# EasyEDA Pro project ProPrj_核心板—舵机连接部分_2025-04-28.epro

# Schematic Schematic1
Board Name: Board1; Create Date: 2025-04-08; Page Name: P1; Project Name: 省赛1终版; Schematic Name: Schematic1; Update Date: 2025-04-08; Company: 嘉立创EDA; Page Size: A4; Version: V1.0
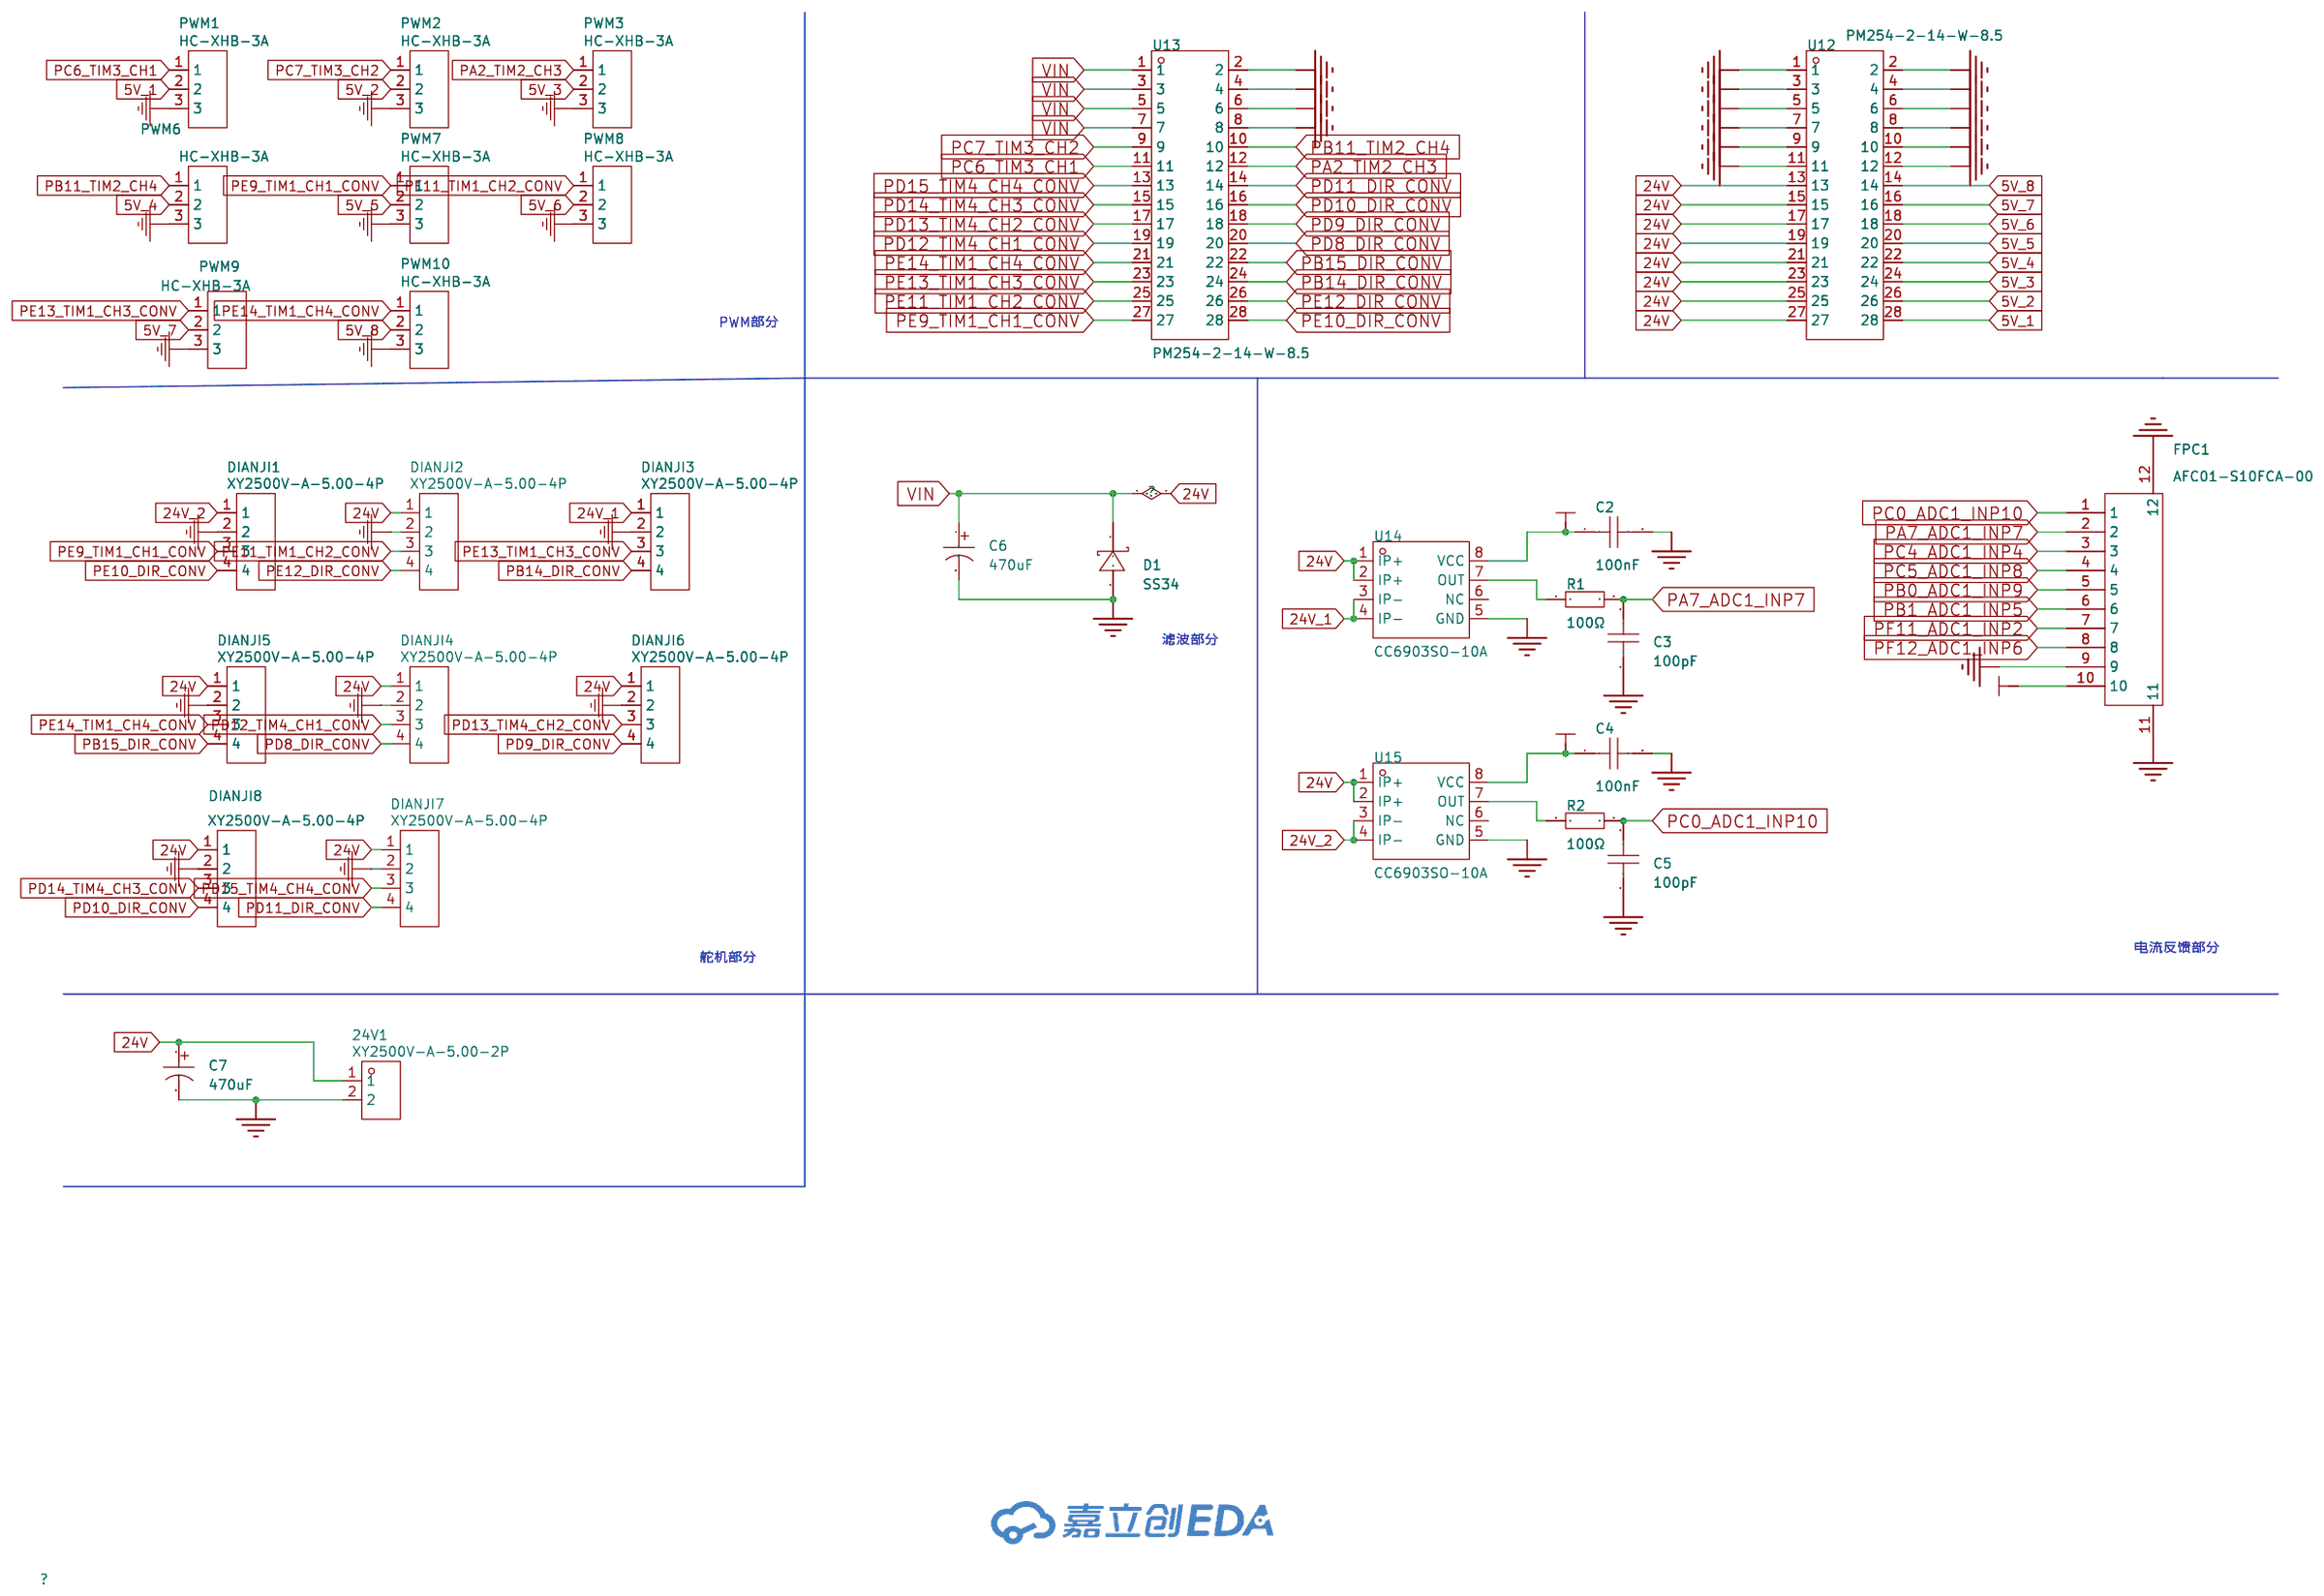
[diagram p0: schematic sheet]

## Parts
24V1  XY2500V-A-5.00-2P  [CONN-TH_XY2500V-A-5.00-2P]
C2  100nF  [C0603]
C3  100pF  [C0603]
C4  100nF  [C0603]
C5  100pF  [C0603]
C6  470uF  [CAP-TH_BD10.0-P5.00-D1.0-FD]
C7  470uF  [CAP-TH_BD10.0-P5.00-D1.0-FD]
D1  SS34  [SMA_L4.3-W2.6-LS5.2-RD]
DIANJI1  XY2500V-A-5.00-4P  [CONN-TH_XY2500V-A-5.00-4P]
DIANJI2  XY2500V-A-5.00-4P  [CONN-TH_XY2500V-A-5.00-4P]
DIANJI3  XY2500V-A-5.00-4P  [CONN-TH_XY2500V-A-5.00-4P]
DIANJI4  XY2500V-A-5.00-4P  [CONN-TH_XY2500V-A-5.00-4P]
DIANJI5  XY2500V-A-5.00-4P  [CONN-TH_XY2500V-A-5.00-4P]
DIANJI6  XY2500V-A-5.00-4P  [CONN-TH_XY2500V-A-5.00-4P]
DIANJI7  XY2500V-A-5.00-4P  [CONN-TH_XY2500V-A-5.00-4P]
DIANJI8  XY2500V-A-5.00-4P  [CONN-TH_XY2500V-A-5.00-4P]
FPC1  AFC01-S10FCA-00  [FPC-SMD_P0.5-10P_FGS-XJ-H2.0]
PWM1  HC-XHB-3A  [CONN-TH_3P-P2.50_HC-XHB-3A]
PWM2  HC-XHB-3A  [CONN-TH_3P-P2.50_HC-XHB-3A]
PWM3  HC-XHB-3A  [CONN-TH_3P-P2.50_HC-XHB-3A]
PWM6  HC-XHB-3A  [CONN-TH_3P-P2.50_HC-XHB-3A]
PWM7  HC-XHB-3A  [CONN-TH_3P-P2.50_HC-XHB-3A]
PWM8  HC-XHB-3A  [CONN-TH_3P-P2.50_HC-XHB-3A]
PWM9  HC-XHB-3A  [CONN-TH_3P-P2.50_HC-XHB-3A]
PWM10  HC-XHB-3A  [CONN-TH_3P-P2.50_HC-XHB-3A]
R1  100Ω  [R0805]
R2  100Ω  [R0805]
U12  PM254-2-14-W-8.5  [HDR-TH_28P-P2.54-H-F-R2-C14-W8.5]
U13  PM254-2-14-W-8.5  [HDR-TH_28P-P2.54-H-F-R2-C14-W8.5]
U14  CC6903SO-10A  [SOP-8_L4.9-W3.9-P1.27-LS6.0-BL]
U15  CC6903SO-10A  [SOP-8_L4.9-W3.9-P1.27-LS6.0-BL]

## Library data of the parts
24V1 = XY2500V-A-5.00-2P: 连接器类型:板端/插座-开口;结构:1x2P;间距:5mm;颜色:绿色;安装方式:直针;排数:1;每排PIN数:2;额定电流:15A;额定电压:300V;触头材质:黄铜;触头镀层:锡;工作温度范围:-;; LCSC Part Name: 1x2P 5mm 排数:1 每排P数:2; Supplier Part: C505761; Manufacturer: XINLAIYA(新莱亚); Supplier Footprint: 插件,P=5mm; JLCPCB Part Class: Extended Part; Datasheet: https://atta.szlcsc.com/upload/public/pdf/source/20200331/C505762_203BBA30CC567BF272D649DCBBD7E810.pdf; Supplier: LCSC; Connector Type: 板端/插座-开口; Structure: 1x2P; Pitch: 5mm; Color: 绿色; Mounting Style: 直针; Number of Pins: 2P; Number of Rows: 1; Number of PINs Per Row: 2; Current Rating (Max): 15A; Voltage Rating (Max): 300V; Contact Material: 黄铜; Contact Plating: 锡
C2 C4 = CGA0603X7R104K500JT: 容值:100nF;精度:±10%;额定电压:50V;温度系数:X7R;; LCSC Part Name: 100nF ±10% 50V; Supplier Part: C6119867; Manufacturer: HRE(芯声); Supplier Footprint: 0603; JLCPCB Part Class: 扩展库; Datasheet: https://atta.szlcsc.com/upload/public/pdf/source/20250103/C44077DA9E7B3EFAE02F22B6D3D1CBC9.pdf; Supplier: LCSC; Tolerance: ±10%; Voltage Rating: 50V; Temperature Coefficient: X7R
C3 C5 = CC0603JRNPO9BN101: 容值:100pF;精度:±5%;额定电压:50V;材质(温度系数):NP0;; LCSC Part Name: 100pF ±5% 50V; Supplier Part: C14665; Manufacturer: YAGEO(国巨); Supplier Footprint: 0603; JLCPCB Part Class: Extended Part; Datasheet: https://atta.szlcsc.com/upload/public/pdf/source/20181008/C309499_21CC21451B82C39E3D92150FD6B30293.pdf; Supplier: LCSC; Tolerance: ±5%; Voltage Rated: 50V; Temperature Coefficient: NP0
C6 C7 = ERS1HM471G20OT: 容值:470uF;精度:±20%;额定电压:50V;; LCSC Part Name: 470uF ±20% 50V; Supplier Part: C106666; Manufacturer: AISHI(艾华集团); Supplier Footprint: 插件,D10xL20mm; JLCPCB Part Class: 扩展库; Datasheet: https://atta.szlcsc.com/upload/public/pdf/source/20191015/C438940_4B8E60A742BB0AE40DDEF87A5C89089D.pdf; Supplier: LCSC; Tolerance: ±20%; Rated Voltage: 50V; Lead Spacing: 5mm; φD: 10mm; L: 20mm; Lifetime @ Temp: 7000hrs@105℃
D1 = SS34_C8678: 二极管配置:独立式;正向压降(Vf):550mV@3A;直流反向耐压(Vr):40V;整流电流:3A;; LCSC Part Name: 电压:40V 电流:3A; Supplier Part: C8678; Manufacturer: MDD(辰达半导体); Supplier Footprint: SMA(DO-214AC); JLCPCB Part Class: 基础库; Datasheet: https://atta.szlcsc.com/upload/public/pdf/source/20240710/2118BB86FDDB2E0B294389AC1F3F65C8.pdf; Supplier: LCSC; Diode Configuration: 独立式; Forward Voltage (Vf@If): 550mV@3A; Reverse Voltage (Vr): 40V; Rectified Current: 3A; Reverse Leakage Current (Ir): 500uA@40V
DIANJI1-DIANJI8 = XY2500V-A-5.00-4P: 连接器类型:板端/插座-开口;结构:1x4P;间距:5mm;颜色:绿色;安装方式:直针;排数:1;每排PIN数:4;额定电流:15A;额定电压:300V;触头材质:黄铜;触头镀层:锡;工作温度范围:-;; LCSC Part Name: 1x4P 5mm 排数:1 每排P数:4; Supplier Part: C505763; Manufacturer: XINLAIYA(新莱亚); Supplier Footprint: 插件,P=5mm; JLCPCB Part Class: Extended Part; Datasheet: https://atta.szlcsc.com/upload/public/pdf/source/20200331/C505762_203BBA30CC567BF272D649DCBBD7E810.pdf; Supplier: LCSC; Connector Type: 板端/插座-开口; Structure: 1x4P; Pitch: 5mm; Color: 绿色; Mounting Style: 直针; Number of Pins: 4P; Number of Rows: 1; Number of PINs Per Row: 4; Current Rating (Max): 15A; Voltage Rating (Max): 300V; Contact Material: 黄铜; Contact Plating: 锡
FPC1 = AFC01-S10FCA-00: 锁定特性:翻盖式;触点类型:下接;触点数量:10P;间距:0.5mm;安装类型:卧贴;; LCSC Part Name: 间距:0.5mm P数:10P 翻盖式 下接; Supplier Part: C262659; Manufacturer: JS(钜硕电子); Supplier Footprint: SMD,P=0.5mm,卧贴; JLCPCB Part Class: 扩展库; Datasheet: https://atta.szlcsc.com/upload/public/pdf/source/20190816/C413942_2A72D1AC756EAE17EEDF756A339D4500.pdf; Supplier: LCSC; Locking Feature: 翻盖式; Contact Type: 下接; Number of Contacts: 10P; Pitch: 0.5mm; Mounting Type: 卧贴; FFC, FCB Thickness: 0.3mm; Height Above Board: 2mm
PWM1-PWM3 PWM6-PWM10 = HC-XHB-3A: Supplier: LCSC; Supplier Part: C2845491; Manufacturer: HCTL(华灿天禄); JLCPCB Part Class: Extended Part
R1 R2 = 0805W8F1000T5E: 电阻类型:厚膜电阻;阻值:100Ω;精度:±1%;功率:125mW;最大工作电压:150V;温度系数:±100ppm/℃;; LCSC Part Name: 100Ω ±1% 125mW 厚膜电阻; Supplier Part: C17408; Manufacturer: UNI-ROYAL(厚声); Supplier Footprint: 0805; JLCPCB Part Class: Basic Part; Datasheet: https://atta.szlcsc.com/upload/public/pdf/source/20200306/C422600_1E6D84923E4A46A82E41ADD87F860B5C.pdf; Supplier: LCSC; Type: 厚膜电阻; Tolerance: ±1%; Power(Watts): 125mW; Overload Voltage (Max): 150V; Temperature Coefficient: ±100ppm/℃; Operating Temperature Range: -55℃~+155℃
U12 U13 = PM254-2-14-W-8.5: 插孔结构:2x14P;间距:2.54mm;行距:2.54mm;圆孔/方孔:方孔;安装类型:弯插;排数:双排;总孔位数:28P;额定电流:3A;额定电压:-;插孔方向:侧面;塑高:8.5mm;触头材质:铜合金;工作温度范围:-40℃~+105℃;焊接温度(最大值):260℃@5S;; LCSC Part Name: 2x14P 间距:2.54mm 弯插; Supplier Part: C2897434; Manufacturer: HCTL(华灿天禄); Supplier Footprint: 弯插,P=2.54mm; JLCPCB Part Class: Extended Part; Datasheet: https://atta.szlcsc.com/upload/public/pdf/source/20230609/283C0D22EF4E6FFE03D5A855876981ED.pdf; Supplier: LCSC; Holes Structure: 2x14P; Pitch: 2.54mm; Row Spacing: 2.54mm; Circular Hole / Square Hole: 方孔; Mounting Type: 弯插; Number of Rows: 双排; Number of Holes: 28P; Current Rating (Max): 3A; Holes Direction: 侧面; Insulation Height: 8.5mm; Contact Material: 铜合金; Operating Temperature Range: -40℃~+105℃; Soldering Temperature(Max): 260℃@5S
U14 U15 = CC6903SO-10A: 电流测量范围:-10A~10A;隔离耐压:100Vrms;灵敏度:132mV/A;; Supplier Part: C469386; Manufacturer: CrossChip(成都芯进); Supplier Footprint: SOP-8; JLCPCB Part Class: 扩展库; Datasheet: https://atta.szlcsc.com/upload/public/pdf/source/20210401/C469386_736CACCB33E89B0F82D9E8414A64AB06.pdf; Supplier: LCSC; Current Range: -10A~10A; Supply Voltage: 3.3V; Isolated Voltage Withstand: 100Vrms; Sensitivity: 132mV/A; Standby Current: 5mA; Operating Temperature: -40℃~+125℃

## Nets
3V32: C2.1 C4.1 FPC1.10 U14.8(VCC) U15.8(VCC)
5V_1: PWM1.2 U12.28
5V_2: PWM2.2 U12.26
5V_3: PWM3.2 U12.24
5V_4: PWM6.2 U12.22
5V_5: PWM7.2 U12.20
5V_6: PWM8.2 U12.18
5V_7: PWM9.2 U12.16
5V_8: PWM10.2 U12.14
24V: 24V1.1 C6.1 C7.1 D1.1(K) DIANJI2.1 DIANJI4.1 DIANJI5.1 DIANJI6.1 DIANJI7.1 DIANJI8.1 U12.13 U12.15 U12.17 U12.19 U12.21 U12.23 U12.25 U12.27 U13.1 U13.3 U13.5 U13.7 U14.1(IP+) U14.2(IP+) U15.1(IP+) U15.2(IP+)
24V_1: DIANJI3.1 U14.3(IP-) U14.4(IP-)
24V_2: DIANJI1.1 U15.3(IP-) U15.4(IP-)
GND: 24V1.2 C2.2 C3.1 C4.2 C5.1 C6.2 C7.2 D1.2(A) DIANJI1.2 DIANJI2.2 DIANJI3.2 DIANJI4.2 DIANJI5.2 DIANJI6.2 DIANJI7.2 DIANJI8.2 FPC1.9 FPC1.11 FPC1.12 PWM1.3 PWM2.3 PWM3.3 PWM6.3 PWM7.3 PWM8.3 PWM9.3 PWM10.3 U12.1 U12.2 U12.3 U12.4 U12.5 U12.6 U12.7 U12.8 U12.9 U12.10 U12.11 U12.12 U13.2 U13.4 U13.6 U13.8 U14.5(GND) U15.5(GND)
PA2_TIM2_CH3: PWM3.1 U13.12
PA7_ADC1_INP7: C3.2 FPC1.2 R1.2
PB0_ADC1_INP9: FPC1.5
PB1_ADC1_INP5: FPC1.6
PB11_TIM2_CH4: PWM6.1 U13.10
PB14_DIR_CONV: DIANJI3.4 U13.24
PB15_DIR_CONV: DIANJI5.4 U13.22
PC0_ADC1_INP10: C5.2 FPC1.1 R2.2
PC4_ADC1_INP4: FPC1.3
PC5_ADC1_INP8: FPC1.4
PC6_TIM3_CH1: PWM1.1 U13.11
PC7_TIM3_CH2: PWM2.1 U13.9
PD8_DIR_CONV: DIANJI4.4 U13.20
PD9_DIR_CONV: DIANJI6.4 U13.18
PD10_DIR_CONV: DIANJI8.4 U13.16
PD11_DIR_CONV: DIANJI7.4 U13.14
PD12_TIM4_CH1_CONV: DIANJI4.3 U13.19
PD13_TIM4_CH2_CONV: DIANJI6.3 U13.17
PD14_TIM4_CH3_CONV: DIANJI8.3 U13.15
PD15_TIM4_CH4_CONV: DIANJI7.3 U13.13
PE9_TIM1_CH1_CONV: DIANJI1.3 PWM7.1 U13.27
PE10_DIR_CONV: DIANJI1.4 U13.28
PE11_TIM1_CH2_CONV: DIANJI2.3 PWM8.1 U13.25
PE12_DIR_CONV: DIANJI2.4 U13.26
PE13_TIM1_CH3_CONV: DIANJI3.3 PWM9.1 U13.23
PE14_TIM1_CH4_CONV: DIANJI5.3 PWM10.1 U13.21
PF11_ADC1_INP2: FPC1.7
PF12_ADC1_INP6: FPC1.8
$1N7510: R1.1 U14.7(OUT)
$1N7913: R2.1 U15.7(OUT)

Not connected (* = marked no-connect by the designer): U14 6(NC); U15 6(NC)

## Notes on the sheet
- PWM部分
- 滤波部分
- 电流反馈部分
- 舵机部分

# Board PCB1
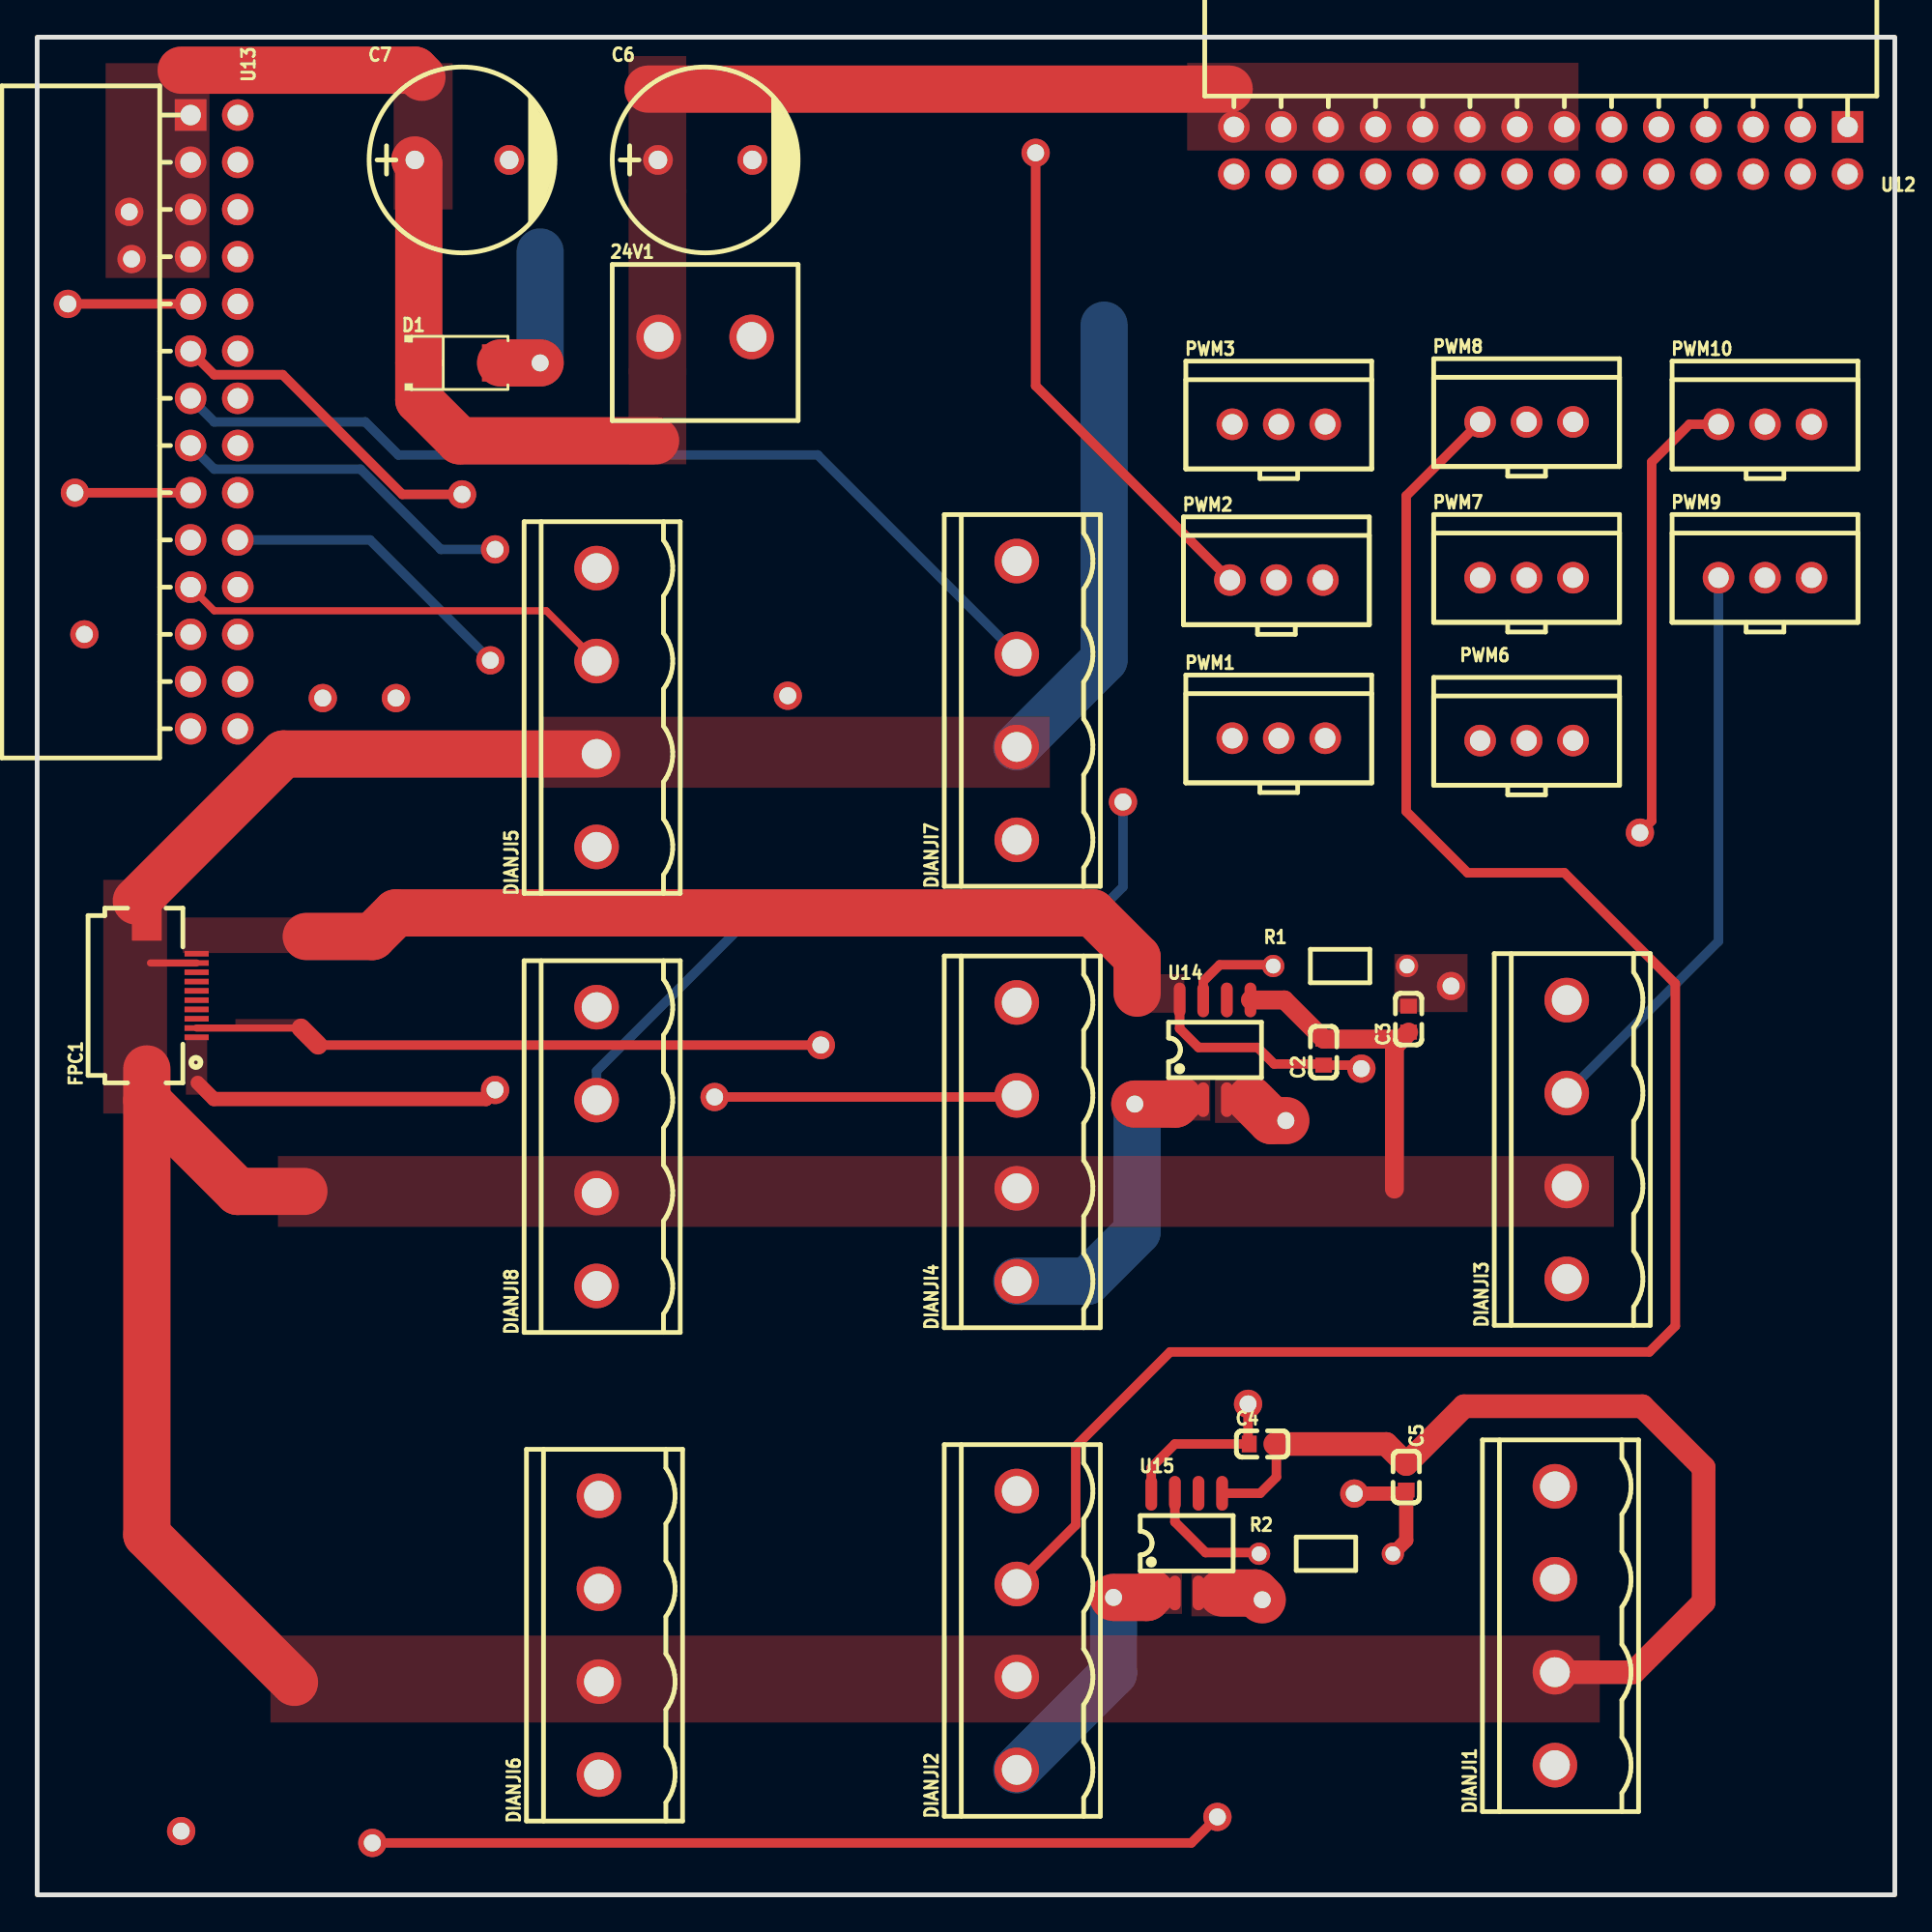
[diagram p1: board, top side]
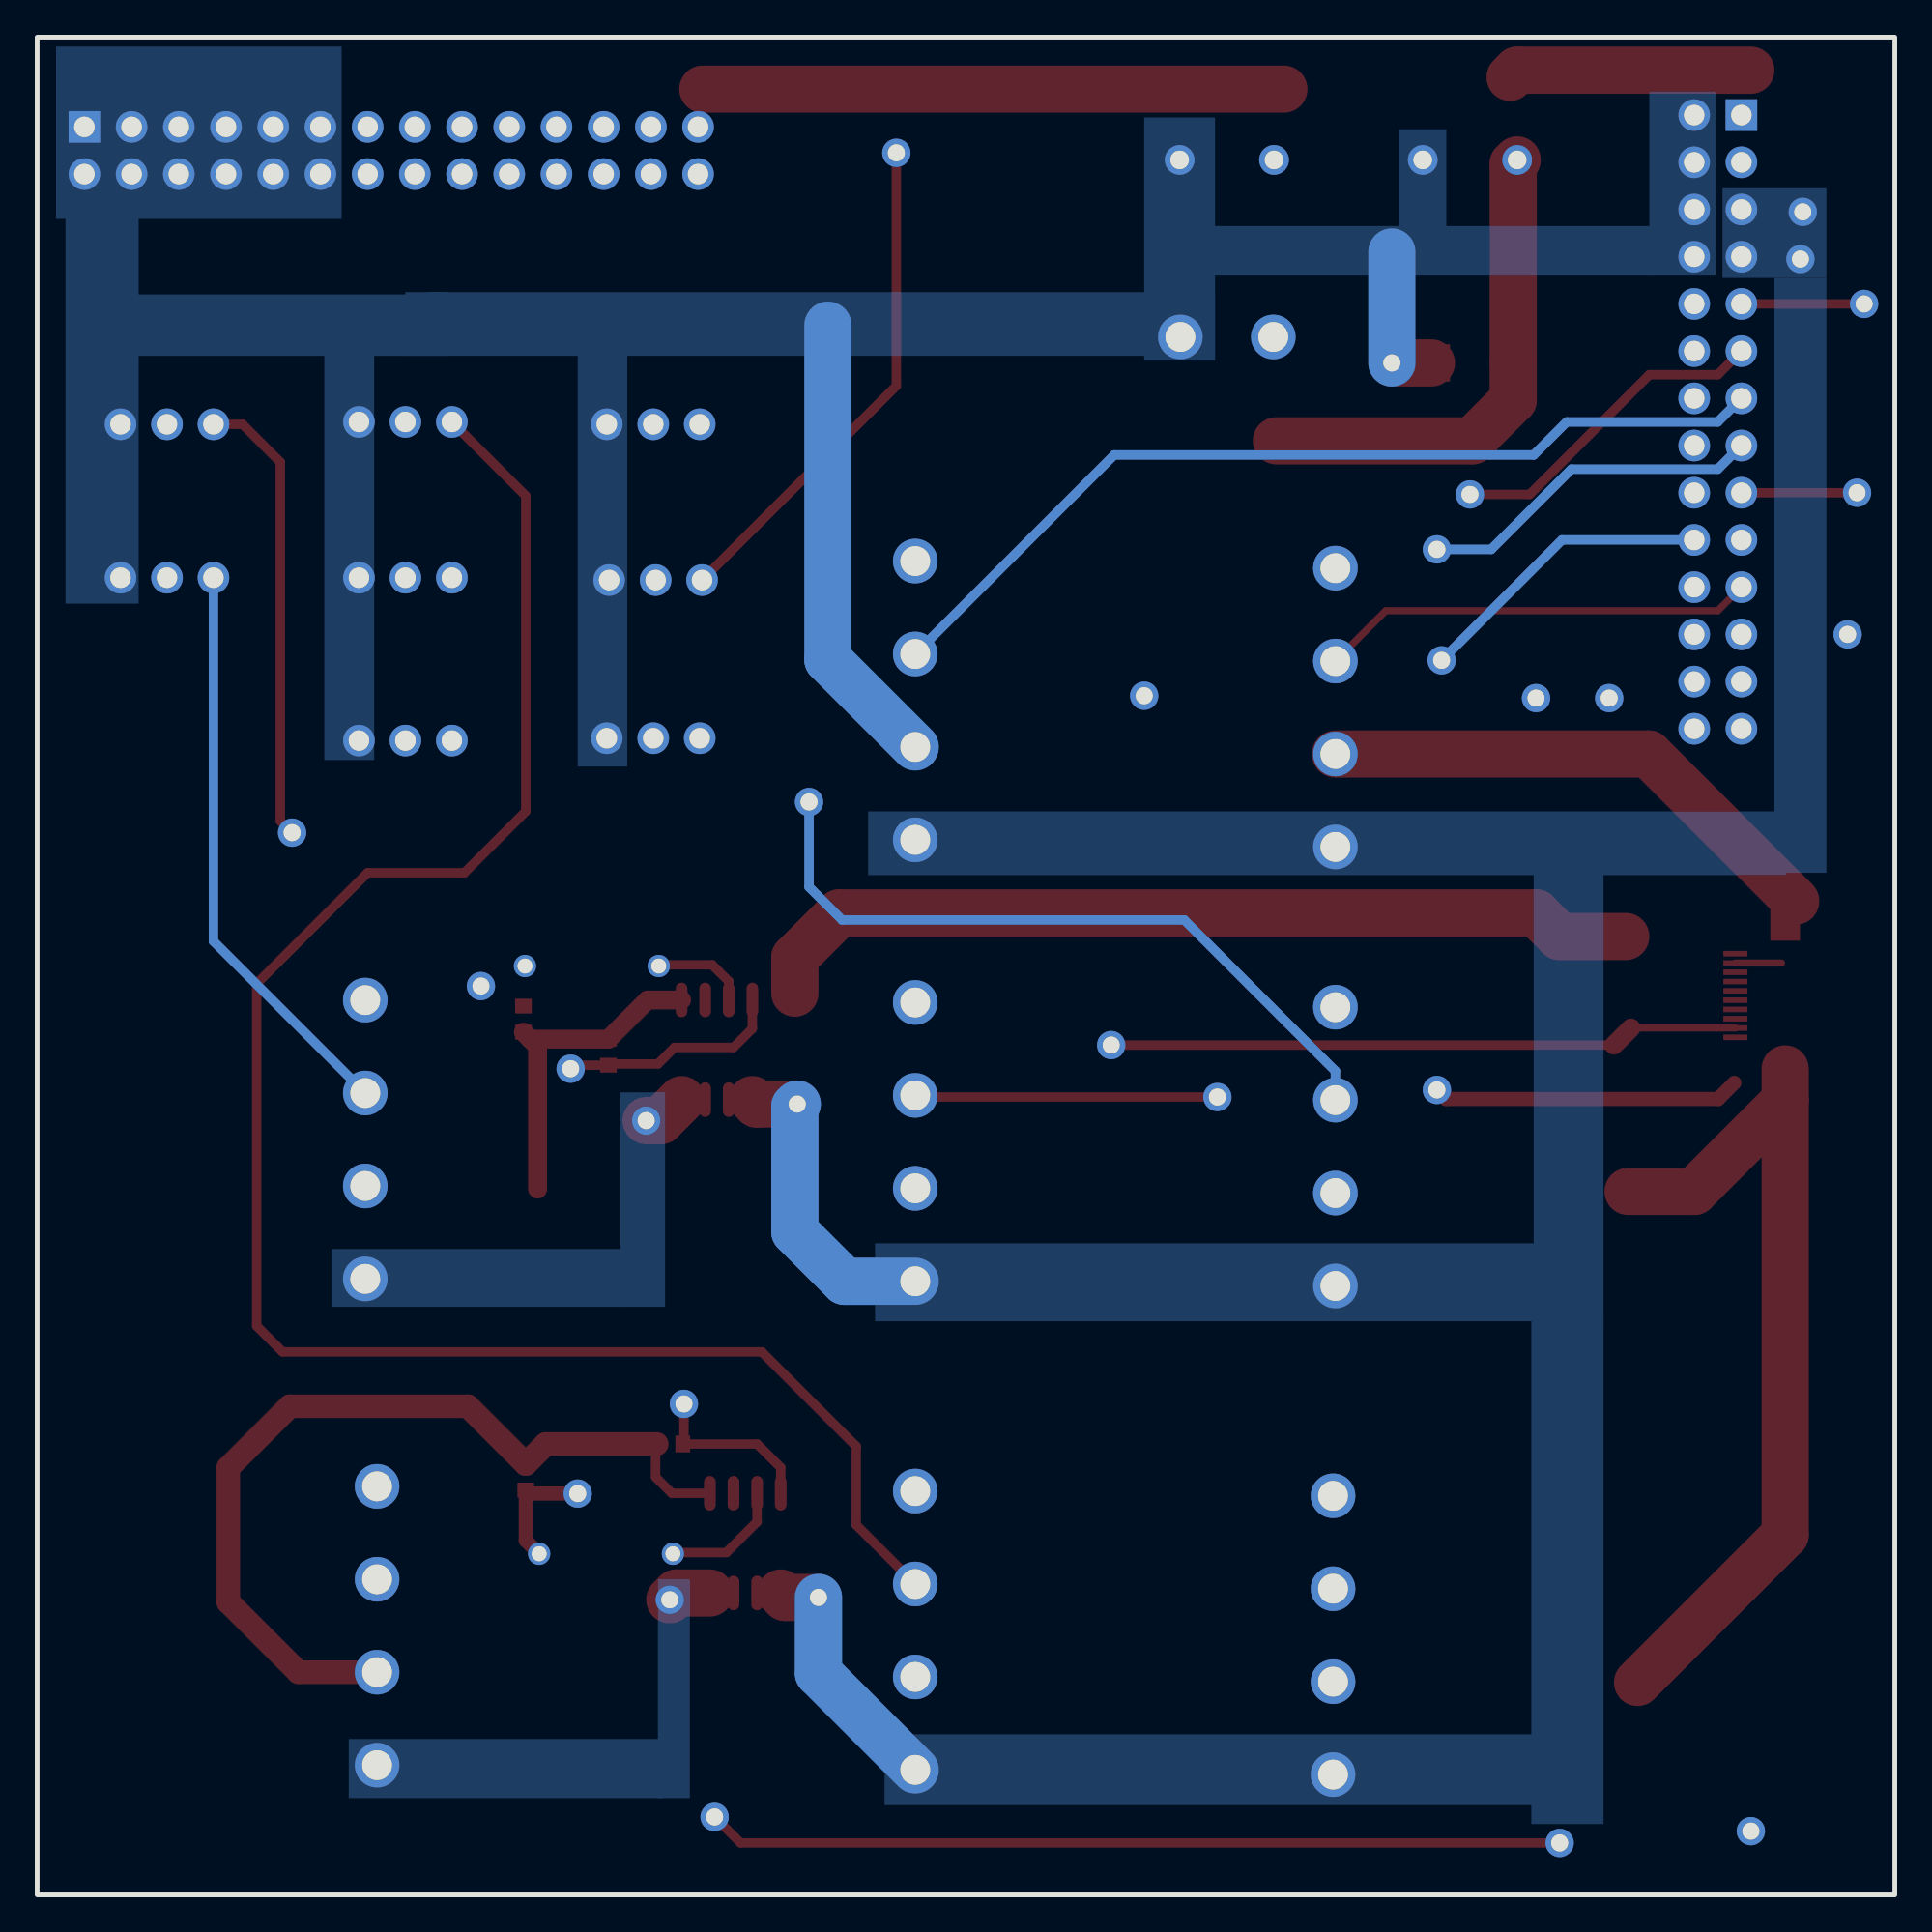
[diagram p2: board, bottom side, seen from below]

Outline 99.95 x 99.95 mm; copper layers: Top Layer, Inner1, Inner2, Bottom Layer. Coordinates in mm from the lower left corner of the outline.
Outline path: rectangle 0,99.95 99.95,0
Stack: Top Layer 0.035mm 外层铜厚1oz / Dielectric1 0.2104mm 7628 RC49% 8.6mil / Inner1 0.0152mm 内层铜厚 / Dielectric2 1.065mm 1.1mm H/HOZ Copper / Inner2 0.0152mm 内层铜厚 / Dielectric3 0.2104mm 7628 RC49% 8.6mil / Bottom Layer 0.035mm 外层铜厚1oz

## Design rules (mm)
template: JLCPCB Capability(Two Layers Board)
spacing copperThickness1oz (default): track to track 0.102, other pairs 0.152 to 0.3
spacing copperThickness2oz: track to track 0.203, other pairs 0.152 to 0.3
track width copperThickness1oz (default): min 0.127, default 0.254, max 2.54
track width copperThickness2oz: min 0.203, default 0.254, max 2.54
differential pair differentialPair (default): width min 0.127, default 0.254, max 2.54; gap min 0.152, default 0.152
via viaSize (default): diameter min 0.5, default 0.61, max 10; hole min 0.3, default 0.305, max 6.3
net GND uses copperThickness2oz
net 24V_1 uses copperThickness2oz
net 24V uses copperThickness2oz
net 24V_2 uses copperThickness2oz
net 3V32 uses copperThickness2oz
net 5V_1 uses copperThickness2oz
net 5V_2 uses copperThickness2oz
net 5V_3 uses copperThickness2oz
net 5V_4 uses copperThickness2oz
net 5V_5 uses copperThickness2oz
net 5V_6 uses copperThickness2oz
net 5V_7 uses copperThickness2oz
net 5V_8 uses copperThickness2oz
net $1N7510 uses copperThickness2oz
net $1N7913 uses copperThickness2oz

## Placement (name value [footprint] x y rotation side)
24V1  XY2500V-A-5.00-2P  [CONN-TH_XY2500V-A-5.00-2P]  35.94 83.82 0 top
C2  100nF  [C0603]  69.22 45.34 90 top
C3  100pF  [C0603]  73.79 47.12 90 top
C4  100nF  [C0603]  65.91 24.26 0 top
C5  100pF  [C0603]  73.66 22.48 270 top
C6  470uF  [CAP-TH_BD10.0-P5.00-D1.0-FD]  35.94 93.34 0 top
C7  470uF  [CAP-TH_BD10.0-P5.00-D1.0-FD]  22.86 93.34 0 top
D1  SS34  [SMA_L4.3-W2.6-LS5.2-RD]  22.73 82.42 0 top
DIANJI1  XY2500V-A-5.00-4P  [CONN-TH_XY2500V-A-5.00-4P]  81.66 14.48 90 top
DIANJI2  XY2500V-A-5.00-4P  [CONN-TH_XY2500V-A-5.00-4P]  52.7 14.22 90 top
DIANJI3  XY2500V-A-5.00-4P  [CONN-TH_XY2500V-A-5.00-4P]  82.3 40.64 90 top
DIANJI4  XY2500V-A-5.00-4P  [CONN-TH_XY2500V-A-5.00-4P]  52.7 40.51 90 top
DIANJI5  XY2500V-A-5.00-4P  [CONN-TH_XY2500V-A-5.00-4P]  30.1 63.88 90 top
DIANJI6  XY2500V-A-5.00-4P  [CONN-TH_XY2500V-A-5.00-4P]  30.23 13.97 90 top
DIANJI7  XY2500V-A-5.00-4P  [CONN-TH_XY2500V-A-5.00-4P]  52.7 64.26 90 top
DIANJI8  XY2500V-A-5.00-4P  [CONN-TH_XY2500V-A-5.00-4P]  30.1 40.26 90 top
FPC1  AFC01-S10FCA-00  [FPC-SMD_P0.5-10P_FGS-XJ-H2.0]  7.24 48.39 90 top
NOREF  -  [Pad_e599]  86.23 57.15 0 top
NOREF#2  -  [Pad_e710]  24.64 72.39 0 top
NOREF#3  -  [Pad_e539]  2.54 67.82 0 top
NOREF#4  -  [Pad_e614]  24.38 66.42 0 top
NOREF#5  -  [Pad_e383]  70.87 21.59 0 top
NOREF#6  -  [Pad_e721]  58.42 58.8 0 top
NOREF#7  -  [Pad_e439]  42.16 45.72 0 top
NOREF#8  -  [Pad_e272]  59.06 42.55 0 top
NOREF#9  -  [Pad_e288]  57.91 16 0 top
NOREF#10  -  [Pad_e646]  22.86 75.35 0 top
NOREF#11  -  [Pad_e465]  71.25 44.45 0 top
NOREF#12  -  [Pad_e463]  65.15 26.42 0 top
NOREF#13  -  [Pad_e289]  65.91 15.88 0 top
NOREF#14  -  [Pad_e280]  67.18 41.66 0 top
NOREF#15  -  [Pad_e696]  15.37 64.39 0 top
NOREF#16  -  [Pad_e477]  18.03 2.79 0 top
NOREF#17  -  [Pad_e79]  5.08 88.01 0 top
NOREF#18  -  [Pad_e78]  4.95 90.55 0 top
NOREF#19  -  [Pad_e481]  63.5 4.19 0 top
NOREF#20  -  [Pad_e474]  2.03 75.44 0 top
NOREF#21  -  [Pad_e547]  7.75 3.43 0 top
NOREF#22  -  [Pad_e379]  24.64 43.31 0 top
NOREF#23  -  [Pad_e661]  36.45 42.93 0 top
NOREF#24  -  [Pad_e720]  40.39 64.52 0 top
NOREF#25  -  [Pad_e441]  76.07 48.89 0 top
NOREF#26  -  [Pad_e554]  1.65 85.6 0 top
NOREF#27  -  [Pad_e557]  53.72 93.73 0 top
NOREF#28  -  [Pad_e698]  19.3 64.39 0 top
NOREF#29  -  [Pad_e108]  27.06 82.42 0 top
PWM1  HC-XHB-3A  [CONN-TH_3P-P2.50_HC-XHB-3A]  66.8 62.23 0 top
PWM2  HC-XHB-3A  [CONN-TH_3P-P2.50_HC-XHB-3A]  66.68 70.74 0 top
PWM3  HC-XHB-3A  [CONN-TH_3P-P2.50_HC-XHB-3A]  66.8 79.12 0 top
PWM6  HC-XHB-3A  [CONN-TH_3P-P2.50_HC-XHB-3A]  80.14 62.1 0 top
PWM7  HC-XHB-3A  [CONN-TH_3P-P2.50_HC-XHB-3A]  80.14 70.87 0 top
PWM8  HC-XHB-3A  [CONN-TH_3P-P2.50_HC-XHB-3A]  80.14 79.25 0 top
PWM9  HC-XHB-3A  [CONN-TH_3P-P2.50_HC-XHB-3A]  92.96 70.87 0 top
PWM10  HC-XHB-3A  [CONN-TH_3P-P2.50_HC-XHB-3A]  92.96 79.12 0 top
R1  100Ω  [Res_1/8W]  70.1 49.91 0 top
R2  100Ω  [Res_1/8W]  69.34 18.29 0 top
U12  PM254-2-14-W-8.5  [HDR-TH_28P-P2.54-H-F-R2-C14-W8.5]  80.9 93.85 180 top
U13  PM254-2-14-W-8.5  [HDR-TH_28P-P2.54-H-F-R2-C14-W8.5]  9.52 79.25 270 top
U14  CC6903SO-10A  [SOP-8_L4.9-W3.9-P1.27-LS6.0-BL]  63.37 45.47 0 top
U15  CC6903SO-10A  [SOP-8_L4.9-W3.9-P1.27-LS6.0-BL]  61.85 18.92 0 top

## Footprints (pads in the part's own frame, mm; a bottom-side part is the same pattern mirrored in y, then rotated)
C0603
  rect 0.8x0.9 smd: 1(-0.7,0) 2(0.7,0)
CAP-TH_BD10.0-P5.00-D1.0-FD
  round 1.6 hole 1: 1(-2.54,0) 2(2.54,0)
CONN-TH_3P-P2.50_HC-XHB-3A
  round 1.7 hole 1.1: 1(-2.5,0) 2(0,0) 3(2.5,0)
CONN-TH_XY2500V-A-5.00-2P
  round 2.4 hole 1.6: 1(-2.5,0) 2(2.5,0)
CONN-TH_XY2500V-A-5.00-4P
  round 2.4 hole 1.6: 1(-7.5,0) 2(-2.5,0) 3(2.5,0) 4(7.5,0)
FPC-SMD_P0.5-10P_FGS-XJ-H2.0
  rect 0.3x1.3 smd: 1(-2.25,-1.339) 2(-1.75,-1.339) 3(-1.25,-1.34) 4(-0.75,-1.339) 5(-0.25,-1.34) 6(0.25,-1.339) 7(0.75,-1.339) 8(1.25,-1.339) 9(1.75,-1.339) 10(2.25,-1.34)
  rect 2x1.6 smd: 11(3.95,1.34) 12(-3.95,1.34)
HDR-TH_28P-P2.54-H-F-R2-C14-W8.5
  rect 1.7x1.7 hole 1.1: 1(-16.51,-1.27)
  round 1.7 hole 1.1: 2(-16.51,1.27) 3(-13.97,-1.27) 4(-13.97,1.27) 5(-11.43,-1.27) 6(-11.43,1.27) 7(-8.89,-1.27) 8(-8.89,1.27) 9(-6.35,-1.27) 10(-6.35,1.27) 11(-3.81,-1.27) 12(-3.81,1.27) 13(-1.27,-1.27) 14(-1.27,1.27) 15(1.27,-1.27) 16(1.27,1.27) 17(3.81,-1.27) 18(3.81,1.27) 19(6.35,-1.27) 20(6.35,1.27) 21(8.89,-1.27) 22(8.89,1.27) 23(11.43,-1.27) 24(11.43,1.27) 25(13.97,-1.27) 26(13.97,1.27) 27(16.51,-1.27) 28(16.51,1.27)
Pad_e78
  round 1.524 hole 0.914: 1(0,0)
Pad_e79
  round 1.524 hole 0.914: 2(0,0)
Pad_e108
  round 1.524 hole 0.914: 1(0,0)
Pad_e272
  round 1.524 hole 0.914: 1(0,0)
Pad_e280
  round 1.524 hole 0.914: 1(0,0)
Pad_e288
  round 1.524 hole 0.914: 1(0,0)
Pad_e289
  round 1.524 hole 0.914: 2(0,0)
Pad_e379
  round 1.524 hole 0.914: 1(0,0)
Pad_e383
  round 1.524 hole 0.914: 1(0,0)
Pad_e439
  round 1.524 hole 0.914: 1(0,0)
Pad_e441
  round 1.524 hole 0.914: 1(0,0)
Pad_e463
  round 1.524 hole 0.914: 1(0,0)
Pad_e465
  round 1.524 hole 0.914: 1(0,0)
Pad_e474
  round 1.524 hole 0.914: 1(0,0)
Pad_e477
  round 1.524 hole 0.914: 1(0,0)
Pad_e481
  round 1.524 hole 0.914: 1(0,0)
Pad_e539
  round 1.524 hole 0.914: 1(0,0)
Pad_e547
  round 1.524 hole 0.914: 1(0,0)
Pad_e554
  round 1.524 hole 0.914: 1(0,0)
Pad_e557
  round 1.524 hole 0.914: 1(0,0)
Pad_e599
  round 1.524 hole 0.914: 1(0,0)
Pad_e614
  round 1.524 hole 0.914: 1(0,0)
Pad_e646
  round 1.524 hole 0.914: 1(0,0)
Pad_e661
  round 1.524 hole 0.914: 1(0,0)
Pad_e696
  round 1.524 hole 0.914: 1(0,0)
Pad_e698
  round 1.524 hole 0.914: 1(0,0)
Pad_e710
  round 1.524 hole 0.914: 1(0,0)
Pad_e720
  round 1.524 hole 0.914: 1(0,0)
Pad_e721
  round 1.524 hole 0.914: 2(0,0)
Res_1/8W
  round 1.199 hole 0.8: 1(-3.599,0.063) 2(3.599,0.063)
SMA_L4.3-W2.6-LS5.2-RD
  rect 2x2 smd: 1(-2.2,0) 2(2.2,0)
SOP-8_L4.9-W3.9-P1.27-LS6.0-BL
  oval 0.63x1.865 smd: 1(-1.905,-2.683) 2(-0.635,-2.683) 3(0.635,-2.683) 4(1.905,-2.683) 5(1.905,2.683) 6(0.635,2.683) 7(-0.635,2.683) 8(-1.905,2.683)

## Nets
3V32: C2.1 C4.1 FPC1.10 NOREF#11.1 NOREF#12.1 U14.8 U15.8
5V_1: PWM1.2 U12.28
5V_2: PWM2.2 U12.26
5V_3: PWM3.2 U12.24
5V_4: PWM6.2 U12.22
5V_5: PWM7.2 U12.20
5V_6: PWM8.2 U12.18
5V_7: PWM9.2 U12.16
5V_8: PWM10.2 U12.14
24V: 24V1.1 C6.1 C7.1 D1.1 DIANJI2.1 DIANJI4.1 DIANJI5.1 DIANJI6.1 DIANJI7.1 DIANJI8.1 NOREF#8.1 NOREF#9.1 NOREF#17.2 NOREF#18.1 U12.13 U12.15 U12.17 U12.19 U12.21 U12.23 U12.25 U12.27 U13.1 U13.3 U13.5 U13.7 U14.1 U14.2 U15.1 U15.2
24V_1: DIANJI3.1 NOREF#14.1 U14.3 U14.4
24V_2: DIANJI1.1 NOREF#13.2 U15.3 U15.4
GND: 24V1.2 C2.2 C3.1 C4.2 C5.1 C6.2 C7.2 D1.2 DIANJI1.2 DIANJI2.2 DIANJI3.2 DIANJI4.2 DIANJI5.2 DIANJI6.2 DIANJI7.2 DIANJI8.2 FPC1.9 FPC1.11 FPC1.12 NOREF#29.1 PWM1.3 PWM2.3 PWM3.3 PWM6.3 PWM7.3 PWM8.3 PWM9.3 PWM10.3 U12.1 U12.2 U12.3 U12.4 U12.5 U12.6 U12.7 U12.8 U12.9 U12.10 U12.11 U12.12 U13.2 U13.4 U13.6 U13.8 U14.5 U15.5
PA2_TIM2_CH3: PWM3.1 U13.12
PA7_ADC1_INP7: C3.2 FPC1.2 NOREF#7.1 NOREF#25.1 R1.2
PB0_ADC1_INP9: FPC1.5
PB1_ADC1_INP5: FPC1.6
PB11_TIM2_CH4: PWM6.1 U13.10
PB14_DIR_CONV: DIANJI3.4 U13.24
PB15_DIR_CONV: DIANJI5.4 U13.22
PC0_ADC1_INP10: C5.2 FPC1.1 NOREF#5.1 NOREF#22.1 R2.2
PC4_ADC1_INP4: FPC1.3
PC5_ADC1_INP8: FPC1.4
PC6_TIM3_CH1: NOREF#10.1 PWM1.1 U13.11
PC7_TIM3_CH2: NOREF#26.1 NOREF#27.1 PWM2.1 U13.9
PD8_DIR_CONV: DIANJI4.4 NOREF#4.1 U13.20
PD9_DIR_CONV: DIANJI6.4 U13.18
PD10_DIR_CONV: DIANJI8.4 U13.16
PD11_DIR_CONV: DIANJI7.4 U13.14
PD12_TIM4_CH1_CONV: DIANJI4.3 NOREF#15.1 NOREF#23.1 NOREF#28.1 U13.19
PD13_TIM4_CH2_CONV: DIANJI6.3 NOREF#20.1 U13.17
PD14_TIM4_CH3_CONV: DIANJI8.3 NOREF#2.1 NOREF#6.2 NOREF#24.1 U13.15
PD15_TIM4_CH4_CONV: DIANJI7.3 U13.13
PE9_TIM1_CH1_CONV: DIANJI1.3 NOREF#16.1 NOREF#19.1 PWM7.1 U13.27
PE10_DIR_CONV: DIANJI1.4 U13.28
PE11_TIM1_CH2_CONV: DIANJI2.3 PWM8.1 U13.25
PE12_DIR_CONV: DIANJI2.4 U13.26
PE13_TIM1_CH3_CONV: DIANJI3.3 NOREF#3.1 NOREF#21.1 PWM9.1 U13.23
PE14_TIM1_CH4_CONV: DIANJI5.3 NOREF.1 PWM10.1 U13.21
PF11_ADC1_INP2: FPC1.7
PF12_ADC1_INP6: FPC1.8
$1N7510: R1.1 U14.7
$1N7913: R2.1 U15.7

Pads without a net: U14 6; U15 6

## Routing (per net, layer and track width the routed paths; a pad name or vN(x,y) marks a point on that pad's centre or on a via; arc(x,y) is an arc through that point)
3V32: length 90.3
  Top Layer w0.508: U15.8 59.94,22.99 61.21,24.26 C4.1 65.15,24.32 NOREF#12.1 ; NOREF#11.1 71.06,44.64 C2.1 69.15,44.7 66.55,44.7 65.66,45.59 62.48,45.59 61.47,46.61 U14.8
  Top Layer w2.54: 59.18,48.51 59.18,50.43 56.78,52.83 19.3,52.83 18.03,51.56 14.48,51.56
  Inner1 w0.762: NOREF#11.1 71.25,32.51 NOREF#12.1
5V_1: length 40.5
  Inner2 w0.762: PWM1.2 66.8,64.52 65.53,65.79 59.82,65.79 57.4,68.2 57.4,85.6 U12.28
5V_2: length 27.9
  Inner2 w0.762: U12.26 59.69,85.34 59.69,77.47 66.42,70.74 PWM2.2
5V_3: length 14.6
  Inner2 w0.762: U12.24 66.8,89.92 PWM3.2
5V_4: length 36.2
  Inner2 w0.762: U12.22 72.01,68.83 74.93,65.91 78.99,65.91 80.14,64.77 PWM6.2
5V_5: length 24
  Inner2 w0.762: PWM7.2 74.55,76.45 U12.20
5V_6: length 14.6
  Inner2 w0.762: PWM8.2 77.09,82.3 U12.18
5V_7: length 27.2
  Inner2 w0.762: U12.16 79.63,90.42 86.74,83.31 86.74,77.09 PWM9.2
5V_8: length 17.9
  Inner2 w0.762: PWM10.2 92.96,81.79 U12.14
24V: length 101.6
  Top Layer w2.54: 33.27,78.23 22.73,78.23 20.53,80.43 D1.1 20.53,93.13 C7.1 ; 20.7,97.79 20.32,98.17 7.75,98.17 ; U14.1 61.23,42.55 NOREF#8.1 ; 64.13,97.16 32.87,97.16 ; U15.1 59.71,16 NOREF#9.1
  Bottom Layer w2.54: NOREF#9.1 57.91,11.93 DIANJI2.1 ; DIANJI4.1 56.51,33.01 59.18,35.69 59.18,42.42 NOREF#8.1
24V_1: length 2.4
  Top Layer w2.54: NOREF#14.1 66.41,41.66 U14.4
24V_2: length 2.3
  Top Layer w2.54: NOREF#13.2 65.55,16.24 U15.4
GND: length 175.8
  Top Layer w0.381: FPC1.9 6.1,50.14
  Top Layer w0.508: U15.5 65.8,21.61 66.68,22.48 66.68,24.19 C4.2
  Top Layer w1.016: 73.41,46.04 C2.2 67.11,48.15 U14.5 ; 73.41,46.04 C3.1 ; 73.41,46.04 73.03,45.66 73.03,37.97
  Top Layer w1.27: C4.2 72.58,24.26 C5.1 76.77,26.29 86.36,26.29 89.66,22.99 89.66,15.75 85.89,11.98 DIANJI1.2
  Top Layer w2.54: 13.84,11.43 5.9,19.37 5.9,42.74 ; D1.2 NOREF#29.1 ; 5.9,42.74 10.8,37.85 14.35,37.85 ; 5.9,42.74 FPC1.12 ; 5.33,53.47 13.25,61.38 DIANJI5.2
  Bottom Layer w2.54: 57.4,84.45 57.4,66.46 DIANJI7.2 ; NOREF#29.1 27.06,88.39
PA2_TIM2_CH3: length 58.8
  Inner1 w0.508: PWM3.1 63.75,79.12 55.37,87.5 19.81,87.5 15.37,83.06 U13.12
PA7_ADC1_INP7: length 86.2
  Top Layer w0.381: FPC1.2 14.2,46.64
  Top Layer w0.508: 15.11,45.72 NOREF#7.1
  Top Layer w1.016: 14.2,46.64 15.11,45.72
  Inner2 w0.508: NOREF#25.1 76.2,48.77 76.2,41.15 70.74,35.69 45.47,35.69 42.16,38.99 NOREF#7.1
PB11_TIM2_CH4: length 90.4
  Inner1 w0.508: PWM6.1 73.15,66.59 73.15,82.8 65.15,90.81 18.8,90.81 13.59,85.6 U13.10
PB14_DIR_CONV: length 83.4
  Inner1 w0.508: U13.24 18.8,67.82 24.38,62.23 24.38,55.88 28.19,52.07 78.37,52.07 DIANJI3.4
PB15_DIR_CONV: length 19.7
  Inner1 w0.508: U13.22 29.08,70.36 DIANJI5.4
PC0_ADC1_INP10: length 88.6
  Top Layer w0.762: R2.2 73.66,19.07 C5.2 73.47,21.59 NOREF#5.1 ; 8.64,43.69 9.51,42.82 24.15,42.82 NOREF#22.1
  Inner2 w0.508: NOREF#5.1 70.87,26.16 68.71,28.32 26.8,28.32 24.64,30.48 NOREF#22.1
PC6_TIM3_CH1: length 64.7
  Top Layer w0.508: U13.11 9.52,81.79 13.21,81.79 19.65,75.35 NOREF#10.1
  Inner1 w0.508: PWM1.1 63.88,62.23 56.9,69.22 47.88,69.22 42.93,74.17 24.04,74.17 NOREF#10.1
PC7_TIM3_CH2: length 104
  Top Layer w0.508: PWM2.1 53.72,81.19 NOREF#27.1 ; NOREF#26.1 U13.9
  Inner2 w0.508: NOREF#27.1 53.72,97.92 52.58,99.06 3.05,99.06 0.81,96.82 0.81,86.44 NOREF#26.1
PD8_DIR_CONV: length 52.2
  Inner2 w0.508: NOREF#4.1 26.8,64.01 33.27,64.01 49.27,48.01 DIANJI4.4
  Bottom Layer w0.508: U13.20 17.91,72.9 NOREF#4.1
PD9_DIR_CONV: length 65.9
  Inner2 w0.508: DIANJI6.4 23.61,21.47 17.78,27.31 17.78,68.45 U13.18
PD10_DIR_CONV: length 40.5
  Inner2 w0.508: DIANJI8.4 21.72,56.14 21.72,70.99 14.73,77.98 U13.16
PD11_DIR_CONV: length 45.5
  Inner1 w0.508: U13.14 20.07,80.52 22.86,77.72 46.74,77.72 DIANJI7.4
PD12_TIM4_CH1_CONV: length 67.8
  Top Layer w0.508: DIANJI4.3 52.62,42.93 NOREF#23.1
  Inner1 w0.508: NOREF#15.1 NOREF#28.1
  Inner2 w0.508: U13.19 9.51,71.64 11.54,71.64 15.37,67.82 NOREF#15.1 ; NOREF#23.1 33.66,45.72 22.86,45.72 19.81,48.77 19.81,63.88 NOREF#28.1
PD13_TIM4_CH2_CONV: length 88.4
  Top Layer w0.508: U13.17 NOREF#20.1
  Inner2 w0.508: NOREF#20.1 0.55,73.96 0.55,28.66 12.83,16.38 30.14,16.38 DIANJI6.3
PD14_TIM4_CH3_CONV: length 102.2
  Inner1 w0.508: NOREF#6.2 46.1,58.8 NOREF#24.1
  Inner2 w0.508: NOREF#2.1 27.69,75.44 34.54,75.44 40.39,69.6 NOREF#24.1
  Bottom Layer w0.508: NOREF#6.2 58.42,54.23 56.64,52.45 38.23,52.45 30.1,44.32 DIANJI8.3 ; U13.15 9.52,76.71 17.4,76.71 21.72,72.39 NOREF#2.1
PD15_TIM4_CH4_CONV: length 50.1
  Bottom Layer w0.508: U13.13 9.52,79.25 17.65,79.25 19.43,77.47 42,77.47 DIANJI7.3
PE9_TIM1_CH1_CONV: length 210.7
  Top Layer w0.508: NOREF#16.1 62.1,2.79 NOREF#19.1
  Inner1 w0.508: PWM7.1 80.81,67.69 84.5,67.69 97.66,54.52 97.66,22.1 92.54,16.98 DIANJI1.3 81.48,17.15 76.46,17.15 NOREF#19.1 ; 18.03,3.05 18.03,45.42 8.29,55.17 8.29,62.7 U13.27
PE10_DIR_CONV: length 133.6
  Inner1 w0.508: U13.28 10.8,57.4 19.94,48.26 19.94,4.83 23.62,1.14 57.78,1.14 78.62,21.98 DIANJI1.4
PE11_TIM1_CH2_CONV: length 195
  Top Layer w0.508: DIANJI2.3 55.88,19.9 55.88,24.13 60.96,29.21 86.74,29.21 88.14,30.61 88.14,49.02 82.17,54.99 76.96,54.99 73.66,58.29 73.66,75.27 PWM8.1
  Inner2 w0.508: U13.25 5.97,65.28 3.43,62.74 3.43,32.39 17.02,18.8 50.63,18.8 DIANJI2.3
PE12_DIR_CONV: length 113.4
  Inner1 w0.508: DIANJI2.4 49.96,24.47 49.24,24.47 43.64,18.88 43.64,7.45 39.12,2.92 24.64,2.92 22.73,4.83 22.73,50.07 13.67,59.14 13.67,63.2 11.59,65.28 U13.26
PE13_TIM1_CH3_CONV: length 229.5
  Inner1 w0.508: NOREF#3.1 2.54,8.64 NOREF#21.1
  Inner2 w0.508: DIANJI3.3 91.69,33.74 91.69,8.76 84.33,1.4 9.78,1.4 NOREF#21.1 ; U13.23 NOREF#3.1
  Bottom Layer w0.508: PWM9.1 90.46,51.31 DIANJI3.3
PE14_TIM1_CH4_CONV: length 109.9
  Top Layer w0.381: DIANJI5.3 27.39,69.09 9.52,69.09 U13.21
  Top Layer w0.508: NOREF.1 86.87,57.78 86.87,77.09 88.9,79.12 PWM10.1
  Inner1 w0.508: NOREF.1 85.25,58.14 61.12,58.14 60.76,58.49 60.76,61.67 58.04,64.39 48.39,64.39 46.4,66.38 DIANJI5.3
$1N7510: length 5.2
  Top Layer w0.508: U14.7 62.74,49.15 63.63,50.04 66.44,50.04 R1.1
$1N7913: length 6.8
  Top Layer w0.508: U15.7 61.21,20.07 62.87,18.41 65.68,18.41 R2.1

## Copper pours and planes (outline as drawn; the poured copper is in the pictures)
3V32 on Top Layer: 58.67,49.53 61.72,49.53 61.72,47.46 58.67,47.46
3V32 on Top Layer: 7.84,52.59 14.86,52.59 14.86,50.67 7.84,50.67
24V on Top Layer: 31.82,91.77 34.93,91.77 34.93,81.79 31.82,81.79
24V on Top Layer: 19.18,98.55 22.35,98.55 22.35,90.68 19.18,90.68
24V on Top Layer: 31.82,82.14 34.93,82.14 34.93,76.96 31.82,76.96
24V on Top Layer: 3.68,98.55 9.27,98.55 9.27,87 3.68,87
24V on Top Layer: 59.06,17.27 61.59,17.27 61.59,15.11 59.06,15.11
24V on Top Layer: 61.87,98.57 82.93,98.57 82.93,93.85 61.87,93.85
24V on Top Layer: 60.45,43.81 63.12,43.81 63.12,41.66 60.45,41.66
24V on Top Layer: 31.82,98.93 34.93,98.93 34.93,91.57 31.82,91.57
24V on Bottom Layer: 5.84,58.29 55.25,58.29 55.25,54.86 5.84,54.86
24V on Bottom Layer: 15.67,31.06 19.56,31.06 19.56,3.81 15.67,3.81
24V on Bottom Layer: 15.67,56.58 19.43,56.58 19.43,30.48 15.67,30.48
24V on Bottom Layer: 3.68,91.82 9.27,91.82 9.27,87 3.68,87
24V on Bottom Layer: 19.18,8.64 54.36,8.64 54.36,4.83 19.18,4.83
24V on Bottom Layer: 18.92,35.05 54.86,35.05 54.86,30.86 18.92,30.86
24V on Bottom Layer: 3.68,87 6.48,87 6.48,54.99 3.68,54.99
24V_1 on Top Layer: 63.37,43.97 65.91,43.97 65.91,41.53 63.37,41.53
24V_1 on Bottom Layer: 66.17,43.18 68.58,43.18 68.58,31.64 66.17,31.64
24V_1 on Bottom Layer: 68.2,34.75 84.11,34.75 84.11,31.64 68.2,31.64
24V_2 on Top Layer: 62.1,17.27 64.52,17.27 64.52,14.99 62.1,14.99
24V_2 on Bottom Layer: 64.83,16.96 66.55,16.96 66.55,5.21 64.83,5.21
24V_2 on Bottom Layer: 66.29,8.38 83.19,8.38 83.19,5.21 66.29,5.21
GND on Top Layer: 12.55,13.95 84.07,13.95 84.07,9.27 12.55,9.27
GND on Top Layer: 27.11,63.38 54.48,63.38 54.48,59.56 27.11,59.56
GND on Top Layer: 12.95,39.75 84.84,39.75 84.84,35.94 12.95,35.94
GND on Top Layer: 3.56,54.61 6.98,54.61 6.98,42.04 3.56,42.04
GND on Bottom Layer: 12.95,89.79 37.72,89.79 37.72,87.12 12.95,87.12
GND on Bottom Layer: 81.82,84.45 84.5,84.45 84.5,61.06 81.82,61.06
GND on Bottom Layer: 9.65,97.03 13.21,97.03 13.21,87.12 9.65,87.12
GND on Bottom Layer: 78.99,86.11 95.25,86.11 95.25,82.8 78.99,82.8
GND on Bottom Layer: 83.57,99.44 98.93,99.44 98.93,90.17 83.57,90.17
GND on Bottom Layer: 36.58,95.63 40.39,95.63 40.39,82.55 36.58,82.55
GND on Bottom Layer: 77.85,86.23 80.14,86.23 80.14,82.8 77.85,82.8
GND on Bottom Layer: 94.49,90.81 98.43,90.81 98.43,69.47 94.49,69.47
GND on Bottom Layer: 68.2,83.82 70.87,83.82 70.87,60.71 68.2,60.71
GND on Bottom Layer: 24.13,95 26.67,95 26.67,89.53 24.13,89.53
GND on Bottom Layer: 36.58,86.23 78.9,86.23 78.9,82.81 36.58,82.81
PA7_ADC1_INP7 on Top Layer: 73.03,50.62 76.96,50.62 76.96,47.5 73.03,47.5
PA7_ADC1_INP7 on Top Layer: 10.67,47.12 14.2,47.12 14.2,46.64 10.67,46.64
PC0_ADC1_INP10 on Top Layer: 8,46.1 9.14,46.1 9.14,43.05 8,43.05
